# Altium schematic sheet IMU.SchDoc
size A4; SheetNumber: 3; SheetTotal: 5
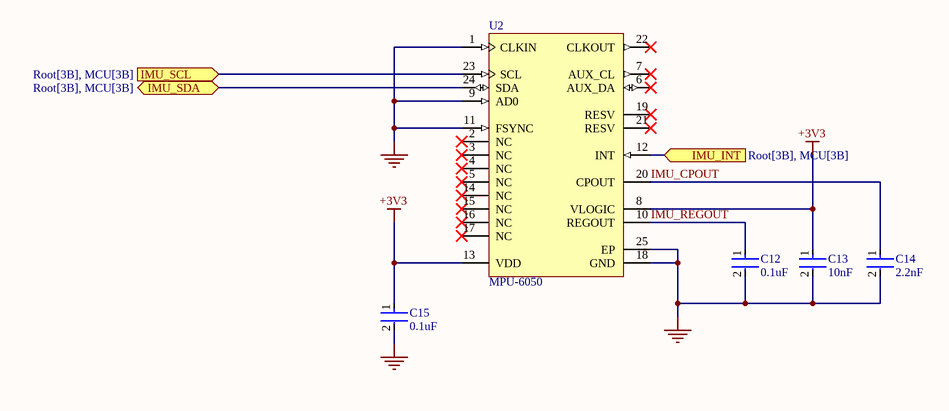
[diagram p0: IMU.SchDoc]

## Parts
C12  0.1uF  [FP-CC0402-MFG]
C13  10nF  [FP-C0402-BB-MFG]
C14  2.2nF  [FP-CC0402-MFG]
C15  0.1uF  [FP-CC0402-MFG]
U2  MPU-6050  [IS-QFN-24_V]

## Ports
IMU_INT (in, see Root[3B], MCU[3B]), IMU_SCL (in, see Root[3B], MCU[3B]), IMU_SDA (bidir, see Root[3B], MCU[3B])

## Nets
+3V3: C13.1 C15.1 U2.8(VLOGIC) U2.13(VDD)
GND: C12.2 C13.2 C14.2 C15.2 U2.1(CLKIN) U2.9(AD0) U2.11(FSYNC) U2.18(GND) U2.25(EP)
IMU_CPOUT: C14.1 U2.20(CPOUT)
IMU_INT: U2.12(INT) ; port IMU_INT
IMU_REGOUT: C12.1 U2.10(REGOUT)
IMU_SCL: U2.23(SCL) ; port IMU_SCL
IMU_SDA: U2.24(SDA) ; port IMU_SDA

Not connected (* = marked no-connect by the designer): U2 2(NC)* 3(NC)* 4(NC)* 5(NC)* 6(AUX_DA)* 7(AUX_CL)* 14(NC)* 15(NC)* 16(NC)* 17(NC)* 19(RESV)* 21(RESV)* 22(CLKOUT)*

## Library data of the parts
C12 C15 = CMP-03422-001121-1: CAP CER 0.1UF 16V X7R 0402; Manufacturer: YAGEO; Manufacturer Part Number: CC0402KPX7R7BB104; Material: Ceramic; Temperature Coefficient: 30ppm/°C; Capacitance: 100 nF; Automotive Grade: NA; Value: 100 nF; Tolerance: 0.1; Digikey Description: CAP CER 0.1UF 16V X7R 0402; Temperature Range Low: -55°C; Footprint Url: http://www.yageo.com/exep/pages/download/literatures/UPY-C_GEN_24.pdf; RoHS: TRUE; Device Class L3: Ceramic Capacitors; Temperature Characteristic: X7R; Package: CC0402; Device Class L1: Passive Components; Lead Free: Yes; Temperature Range High: +125°C; Category: Cap; Mouser Description: 0402 0.1 uF 16 V ±10% Tolerance X7R SMT Multilayer Ceramic Capacitor; Voltage Rating: 16 V; ComponentLink2Description: Datasheet; Automotive: No; Octopart: https://octopart.com/cc0402kpx7r7bb104-yageo-21548559; ComponentLink2URL: http://www.yageo.com/documents/recent/UPY-GP_NP0_16V-to-50V_16.pdf; Height: 0.55mm; Device Class L2: Capacitors; Temperature: -55°C to +125°C; Ipc Land Pattern Name: CAPC10050X50
C13 = CMP-2008-02186-2: CAP CER 10000PF 50V X7R 0402; Manufacturer: Kemet; Manufacturer Part Number: C0402C103K5RACAUTO; Temperature Coefficient: 15%; Material: Ceramic; Tolerance: 0.1; Value: 10,000 pF; Digikey Description: CAP CER 10000PF 50V X7R 0402; Voltage Rating: 50 V; Ipc Land Pattern Name: CAPC10050X50; Temperature Range High: +125°C; Package: C0402-BB; Octopart: https://octopart.com/c0402c103k5racauto-kemet-22884290; ComponentLink2Description: Datasheet; Temperature: -55°C to +125°C; Temperature Characteristic: X7R; Lead Free: Yes; Automotive: No; ComponentLink2URL: https://content.kemet.com/datasheets/KEM_C1002_X7R_SMD.pdf; Device Class L3: Ceramic Capacitors; Device Class L2: Capacitors; Device Class L1: Passive Components; Category: Cap; Height: 0.55mm; RoHS: TRUE; Capacitance: 10,000 pF; Temperature Range Low: -55°C; Mouser Description: Cap Ceramic 0.01uF 50V X7R 10% Pad SMD 0402 125C Automotive T/R
C14 = CMP-03422-000888-1: CAP CER 2200PF 10V X7R 0402; Manufacturer: YAGEO; Manufacturer Part Number: CC0402KRX7R6BB222; Material: Ceramic; Automotive Grade: NA; Tolerance: 0.1; Temperature Coefficient: 30ppm/°C; ComponentLink2Description: Datasheet; Capacitance: 2.2 nF; ComponentLink2URL: http://www.yageo.com/documents/recent/UPY-GP_NP0_16V-to-50V_16.pdf; Octopart: https://octopart.com/cc0402krx7r6bb222-yageo-71334368; Temperature: -55°C to +125°C; Ipc Land Pattern Name: CAPC10050X50; Value: 2.2 nF; Temperature Range High: +125°C; Footprint Url: http://www.yageo.com/exep/pages/download/literatures/UPY-C_GEN_24.pdf; RoHS: TRUE; Package: CC0402; Temperature Range Low: -55°C; Category: Cap; Device Class L3: Ceramic Capacitors; Height: 0.55mm; Lead Free: Yes; Digikey Description: CAP CER 2200PF 10V X7R 0402; Automotive: No; Voltage Rating: 10 V; Device Class L1: Passive Components; Temperature Characteristic: X7R; Device Class L2: Capacitors
U2 = CMP-1753-00002-2: 3-Axis Gyroscope, Accelerometer and a Digital Motion Processor(TM) (DMP), 2.375 to 3.46 V, -40 to 85 degC, 24-Pin QFN, RoHS, Tape and Reel; Manufacturer: InvenSense; Featured Product: MPU-60506-Axis,IntegratedI²CSolution; Other Names: 1428-1007-2 / MPU6050; Sensor Type: MotionTracking; Online Catalog: MPU-6000™Series; Unit PriceUSD: Digital; Datasheet Version: Rev. 3.3, 05/2012; Category: Sensors,Transducers; Datasheet URL: http://datasheet.octopart.com/MPU-6050-InvenSense-datasheet-14421344.pdf; Family: Multifunction; Standard Package: 5,000; Manufacturer URL: http://www.invensense.com/; Output Type: Digital; Dynamic Catalog: MPU-6000™Series